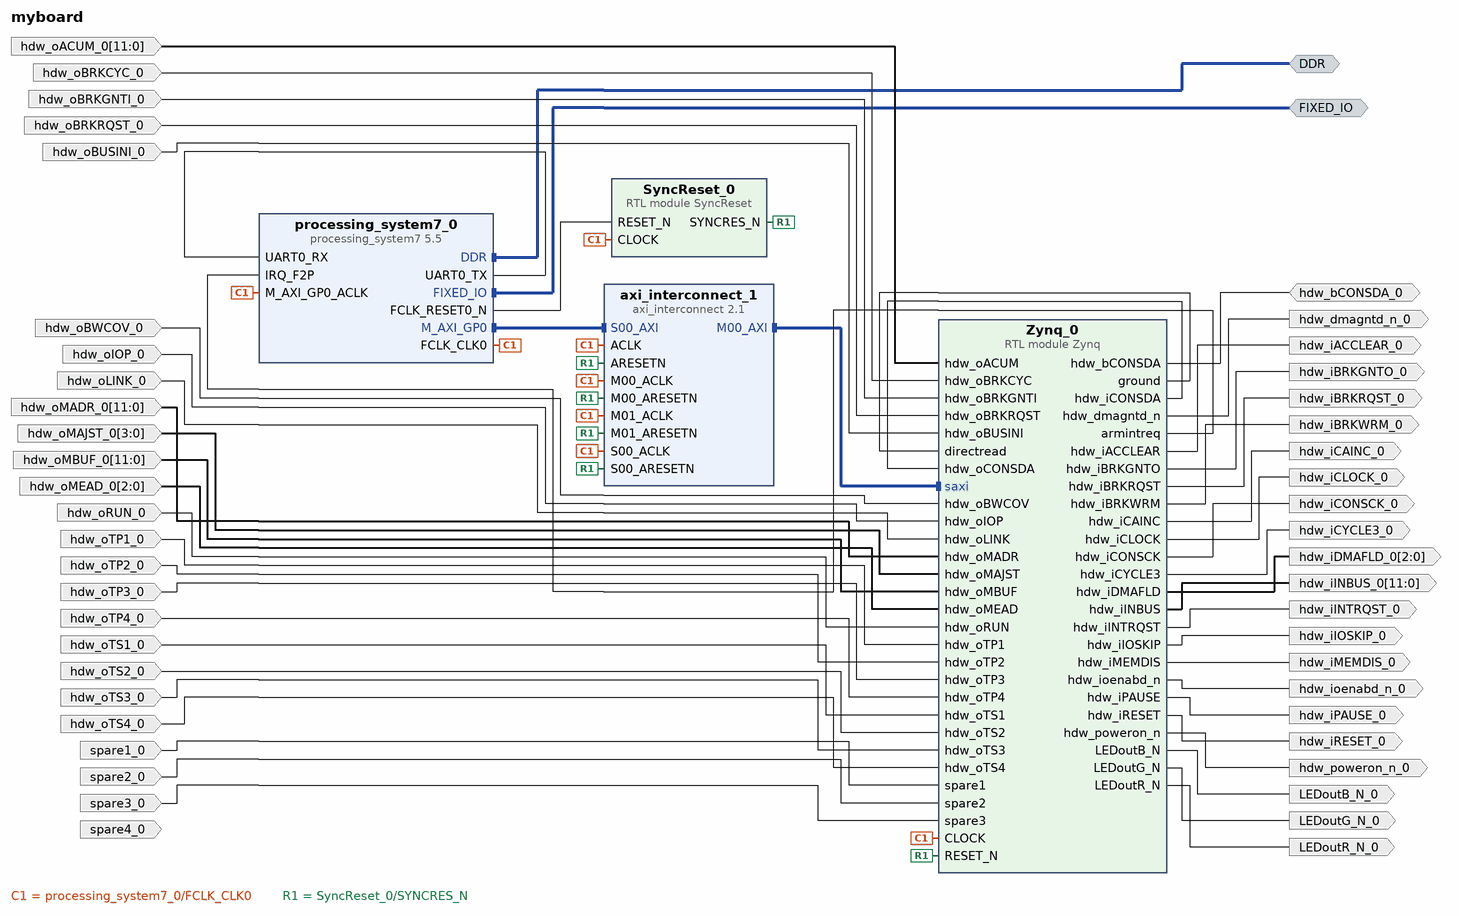
[diagram p0: block diagram of the top level]
# Vivado block design myboard, xc7z020clg400-1, Vivado 2018.3
create_bd_design myboard

create_bd_intf_port -mode Master -vlnv xilinx.com:interface:ddrx_rtl:1.0 DDR
create_bd_intf_port -mode Master -vlnv xilinx.com:display_processing_system7:fixedio_rtl:1.0 FIXED_IO
create_bd_port -dir O LEDoutB_N_0
create_bd_port -dir O LEDoutG_N_0
create_bd_port -dir O LEDoutR_N_0
create_bd_port -dir IO hdw_bCONSDA_0
create_bd_port -dir O hdw_dmagntd_n_0
create_bd_port -dir O hdw_iACCLEAR_0
create_bd_port -dir O hdw_iBRKGNTO_0
create_bd_port -dir O hdw_iBRKRQST_0
create_bd_port -dir O hdw_iBRKWRM_0
create_bd_port -dir O hdw_iCAINC_0
create_bd_port -dir O hdw_iCLOCK_0
create_bd_port -dir O hdw_iCONSCK_0
create_bd_port -dir O hdw_iCYCLE3_0
create_bd_port -dir O -from 2 -to 0 hdw_iDMAFLD_0
create_bd_port -dir O -from 11 -to 0 hdw_iINBUS_0
create_bd_port -dir O hdw_iINTRQST_0
create_bd_port -dir O hdw_iIOSKIP_0
create_bd_port -dir O hdw_iMEMDIS_0
create_bd_port -dir O hdw_iPAUSE_0
create_bd_port -dir O hdw_iRESET_0
create_bd_port -dir O hdw_ioenabd_n_0
create_bd_port -dir I -from 11 -to 0 hdw_oACUM_0
create_bd_port -dir I hdw_oBRKCYC_0
create_bd_port -dir I hdw_oBRKGNTI_0
create_bd_port -dir I hdw_oBRKRQST_0
create_bd_port -dir I hdw_oBUSINI_0
create_bd_port -dir I hdw_oBWCOV_0
create_bd_port -dir I hdw_oIOP_0
create_bd_port -dir I hdw_oLINK_0
create_bd_port -dir I -from 11 -to 0 hdw_oMADR_0
create_bd_port -dir I -from 3 -to 0 hdw_oMAJST_0
create_bd_port -dir I -from 11 -to 0 hdw_oMBUF_0
create_bd_port -dir I -from 2 -to 0 hdw_oMEAD_0
create_bd_port -dir I hdw_oRUN_0
create_bd_port -dir I hdw_oTP1_0
create_bd_port -dir I hdw_oTP2_0
create_bd_port -dir I hdw_oTP3_0
create_bd_port -dir I hdw_oTP4_0
create_bd_port -dir I hdw_oTS1_0
create_bd_port -dir I hdw_oTS2_0
create_bd_port -dir I hdw_oTS3_0
create_bd_port -dir I hdw_oTS4_0
create_bd_port -dir O hdw_poweron_n_0
create_bd_port -dir I spare1_0
create_bd_port -dir I spare2_0
create_bd_port -dir I spare3_0
create_bd_port -dir I spare4_0

create_bd_cell -type module -reference SyncReset SyncReset_0
create_bd_cell -type module -reference Zynq Zynq_0
create_bd_cell -type ip -vlnv xilinx.com:ip:axi_interconnect:2.1 axi_interconnect_1
set_property -dict {CONFIG.NUM_MI 2} [get_bd_cells axi_interconnect_1]
create_bd_cell -type ip -vlnv xilinx.com:ip:processing_system7:5.5 processing_system7_0
set_property -dict [list \
  CONFIG.PCW_APU_PERIPHERAL_FREQMHZ 666.666666 \
  CONFIG.PCW_CAN0_CAN0_IO {MIO 14 .. 15} \
  CONFIG.PCW_CAN0_PERIPHERAL_ENABLE 1 \
  CONFIG.PCW_ENET0_ENET0_IO {MIO 16 .. 27} \
  CONFIG.PCW_ENET0_GRP_MDIO_ENABLE 1 \
  CONFIG.PCW_ENET0_GRP_MDIO_IO {MIO 52 .. 53} \
  CONFIG.PCW_ENET0_PERIPHERAL_CLKSRC {ARM PLL} \
  CONFIG.PCW_ENET0_PERIPHERAL_ENABLE 1 \
  CONFIG.PCW_ENET0_RESET_ENABLE 0 \
  CONFIG.PCW_ENET_RESET_ENABLE 1 \
  CONFIG.PCW_ENET_RESET_SELECT {Share reset pin} \
  CONFIG.PCW_EN_CLK1_PORT 1 \
  CONFIG.PCW_FCLK_CLK1_BUF TRUE \
  CONFIG.PCW_FPGA0_PERIPHERAL_FREQMHZ 100 \
  CONFIG.PCW_FPGA1_PERIPHERAL_FREQMHZ 50 \
  CONFIG.PCW_FPGA_FCLK1_ENABLE 1 \
  CONFIG.PCW_GPIO_MIO_GPIO_ENABLE 1 \
  CONFIG.PCW_GPIO_MIO_GPIO_IO MIO \
  CONFIG.PCW_GPIO_PERIPHERAL_ENABLE 1 \
  CONFIG.PCW_I2C0_I2C0_IO EMIO \
  CONFIG.PCW_I2C0_PERIPHERAL_ENABLE 1 \
  CONFIG.PCW_I2C1_I2C1_IO {MIO 12 .. 13} \
  CONFIG.PCW_I2C1_PERIPHERAL_ENABLE 1 \
  CONFIG.PCW_I2C_PERIPHERAL_FREQMHZ 83.333336 \
  CONFIG.PCW_I2C_RESET_ENABLE 1 \
  CONFIG.PCW_I2C_RESET_SELECT {Share reset pin} \
  CONFIG.PCW_IRQ_F2P_INTR 1 \
  CONFIG.PCW_PRESET_BANK1_VOLTAGE {LVCMOS 1.8V} \
  CONFIG.PCW_QSPI_GRP_FBCLK_ENABLE 1 \
  CONFIG.PCW_QSPI_GRP_FBCLK_IO {MIO 8} \
  CONFIG.PCW_QSPI_GRP_SINGLE_SS_ENABLE 1 \
  CONFIG.PCW_QSPI_GRP_SINGLE_SS_IO {MIO 1 .. 6} \
  CONFIG.PCW_QSPI_PERIPHERAL_ENABLE 1 \
  CONFIG.PCW_QSPI_QSPI_IO {MIO 1 .. 6} \
  CONFIG.PCW_SD0_GRP_CD_ENABLE 1 \
  CONFIG.PCW_SD0_GRP_CD_IO {MIO 46} \
  CONFIG.PCW_SD0_GRP_WP_ENABLE 1 \
  CONFIG.PCW_SD0_GRP_WP_IO {MIO 47} \
  CONFIG.PCW_SD0_PERIPHERAL_ENABLE 1 \
  CONFIG.PCW_SD0_SD0_IO {MIO 40 .. 45} \
  CONFIG.PCW_SDIO_PERIPHERAL_FREQMHZ 100 \
  CONFIG.PCW_SINGLE_QSPI_DATA_MODE x4 \
  CONFIG.PCW_TTC0_PERIPHERAL_ENABLE 1 \
  CONFIG.PCW_TTC0_TTC0_IO EMIO \
  CONFIG.PCW_UART0_PERIPHERAL_ENABLE 1 \
  CONFIG.PCW_UART0_UART0_IO EMIO \
  CONFIG.PCW_UART1_PERIPHERAL_ENABLE 1 \
  CONFIG.PCW_UART1_UART1_IO {MIO 48 .. 49} \
  CONFIG.PCW_UART_PERIPHERAL_FREQMHZ 100 \
  CONFIG.PCW_UIPARAM_DDR_PARTNO {MT41J256M16 RE-125} \
  CONFIG.PCW_USB0_PERIPHERAL_ENABLE 1 \
  CONFIG.PCW_USB0_RESET_ENABLE 1 \
  CONFIG.PCW_USB0_RESET_IO {MIO 51} \
  CONFIG.PCW_USB0_USB0_IO {MIO 28 .. 39} \
  CONFIG.PCW_USB_RESET_ENABLE 1 \
  CONFIG.PCW_USB_RESET_SELECT {Share reset pin} \
  CONFIG.PCW_USE_FABRIC_INTERRUPT 1 \
] [get_bd_cells processing_system7_0]
# 284 more settings of processing_system7_0 are not shown: defaults, MIO pin electricals, DDR timing, and values the tool derives

# ---- connections ----

connect_bd_intf_net [get_bd_intf_pins axi_interconnect_1/M00_AXI] [get_bd_intf_pins Zynq_0/saxi]
connect_bd_intf_net [get_bd_intf_ports DDR] [get_bd_intf_pins processing_system7_0/DDR]
connect_bd_intf_net [get_bd_intf_ports FIXED_IO] [get_bd_intf_pins processing_system7_0/FIXED_IO]
connect_bd_intf_net [get_bd_intf_pins processing_system7_0/M_AXI_GP0] [get_bd_intf_pins axi_interconnect_1/S00_AXI]
connect_bd_net [get_bd_ports hdw_bCONSDA_0] [get_bd_pins Zynq_0/hdw_bCONSDA]
connect_bd_net [get_bd_pins Zynq_0/LEDoutB_N] [get_bd_ports LEDoutB_N_0]
connect_bd_net [get_bd_pins Zynq_0/LEDoutG_N] [get_bd_ports LEDoutG_N_0]
connect_bd_net [get_bd_pins Zynq_0/LEDoutR_N] [get_bd_ports LEDoutR_N_0]
connect_bd_net [get_bd_pins Zynq_0/armintreq] [get_bd_pins processing_system7_0/IRQ_F2P]
connect_bd_net [get_bd_pins Zynq_0/ground] [get_bd_pins Zynq_0/directread]
connect_bd_net [get_bd_pins Zynq_0/hdw_dmagntd_n] [get_bd_ports hdw_dmagntd_n_0]
connect_bd_net [get_bd_pins Zynq_0/hdw_iACCLEAR] [get_bd_ports hdw_iACCLEAR_0]
connect_bd_net [get_bd_pins Zynq_0/hdw_iBRKGNTO] [get_bd_ports hdw_iBRKGNTO_0]
connect_bd_net [get_bd_pins Zynq_0/hdw_iBRKRQST] [get_bd_ports hdw_iBRKRQST_0]
connect_bd_net [get_bd_pins Zynq_0/hdw_iBRKWRM] [get_bd_ports hdw_iBRKWRM_0]
connect_bd_net [get_bd_pins Zynq_0/hdw_iCAINC] [get_bd_ports hdw_iCAINC_0]
connect_bd_net [get_bd_pins Zynq_0/hdw_iCLOCK] [get_bd_ports hdw_iCLOCK_0]
connect_bd_net [get_bd_pins Zynq_0/hdw_iCONSCK] [get_bd_ports hdw_iCONSCK_0]
connect_bd_net [get_bd_pins Zynq_0/hdw_iCONSDA] [get_bd_pins Zynq_0/hdw_oCONSDA]
connect_bd_net [get_bd_pins Zynq_0/hdw_iCYCLE3] [get_bd_ports hdw_iCYCLE3_0]
connect_bd_net [get_bd_pins Zynq_0/hdw_iDMAFLD] [get_bd_ports hdw_iDMAFLD_0]
connect_bd_net [get_bd_pins Zynq_0/hdw_iINBUS] [get_bd_ports hdw_iINBUS_0]
connect_bd_net [get_bd_pins Zynq_0/hdw_iINTRQST] [get_bd_ports hdw_iINTRQST_0]
connect_bd_net [get_bd_pins Zynq_0/hdw_iIOSKIP] [get_bd_ports hdw_iIOSKIP_0]
connect_bd_net [get_bd_pins Zynq_0/hdw_iMEMDIS] [get_bd_ports hdw_iMEMDIS_0]
connect_bd_net [get_bd_pins Zynq_0/hdw_iPAUSE] [get_bd_ports hdw_iPAUSE_0]
connect_bd_net [get_bd_pins Zynq_0/hdw_iRESET] [get_bd_ports hdw_iRESET_0]
connect_bd_net [get_bd_pins Zynq_0/hdw_ioenabd_n] [get_bd_ports hdw_ioenabd_n_0]
connect_bd_net [get_bd_pins Zynq_0/hdw_poweron_n] [get_bd_ports hdw_poweron_n_0]
connect_bd_net -net hdw_oACUM_0_1 [get_bd_ports hdw_oACUM_0] [get_bd_pins Zynq_0/hdw_oACUM]
connect_bd_net -net hdw_oBRKCYC_0_1 [get_bd_ports hdw_oBRKCYC_0] [get_bd_pins Zynq_0/hdw_oBRKCYC]
connect_bd_net -net hdw_oBRKGNTI_0_1 [get_bd_ports hdw_oBRKGNTI_0] [get_bd_pins Zynq_0/hdw_oBRKGNTI]
connect_bd_net -net hdw_oBRKRQST_0_1 [get_bd_ports hdw_oBRKRQST_0] [get_bd_pins Zynq_0/hdw_oBRKRQST]
connect_bd_net -net hdw_oBUSINI_0_1 [get_bd_ports hdw_oBUSINI_0] [get_bd_pins Zynq_0/hdw_oBUSINI]
connect_bd_net -net hdw_oBWCOV_0_1 [get_bd_ports hdw_oBWCOV_0] [get_bd_pins Zynq_0/hdw_oBWCOV]
connect_bd_net -net hdw_oIOP_0_1 [get_bd_ports hdw_oIOP_0] [get_bd_pins Zynq_0/hdw_oIOP]
connect_bd_net -net hdw_oLINK_0_1 [get_bd_ports hdw_oLINK_0] [get_bd_pins Zynq_0/hdw_oLINK]
connect_bd_net -net hdw_oMADR_0_1 [get_bd_ports hdw_oMADR_0] [get_bd_pins Zynq_0/hdw_oMADR]
connect_bd_net -net hdw_oMAJST_0_1 [get_bd_ports hdw_oMAJST_0] [get_bd_pins Zynq_0/hdw_oMAJST]
connect_bd_net -net hdw_oMBUF_0_1 [get_bd_ports hdw_oMBUF_0] [get_bd_pins Zynq_0/hdw_oMBUF]
connect_bd_net -net hdw_oMEAD_0_1 [get_bd_ports hdw_oMEAD_0] [get_bd_pins Zynq_0/hdw_oMEAD]
connect_bd_net -net hdw_oRUN_0_1 [get_bd_ports hdw_oRUN_0] [get_bd_pins Zynq_0/hdw_oRUN]
connect_bd_net -net hdw_oTP1_0_1 [get_bd_ports hdw_oTP1_0] [get_bd_pins Zynq_0/hdw_oTP1]
connect_bd_net -net hdw_oTP2_0_1 [get_bd_ports hdw_oTP2_0] [get_bd_pins Zynq_0/hdw_oTP2]
connect_bd_net -net hdw_oTP3_0_1 [get_bd_ports hdw_oTP3_0] [get_bd_pins Zynq_0/hdw_oTP3]
connect_bd_net -net hdw_oTP4_0_1 [get_bd_ports hdw_oTP4_0] [get_bd_pins Zynq_0/hdw_oTP4]
connect_bd_net -net hdw_oTS1_0_1 [get_bd_ports hdw_oTS1_0] [get_bd_pins Zynq_0/hdw_oTS1]
connect_bd_net -net hdw_oTS2_0_1 [get_bd_ports hdw_oTS2_0] [get_bd_pins Zynq_0/hdw_oTS2]
connect_bd_net -net hdw_oTS3_0_1 [get_bd_ports hdw_oTS3_0] [get_bd_pins Zynq_0/hdw_oTS3]
connect_bd_net -net hdw_oTS4_0_1 [get_bd_ports hdw_oTS4_0] [get_bd_pins Zynq_0/hdw_oTS4]
connect_bd_net [get_bd_pins processing_system7_0/FCLK_CLK0] \
  [get_bd_pins processing_system7_0/M_AXI_GP0_ACLK] [get_bd_pins axi_interconnect_1/ACLK] \
  [get_bd_pins axi_interconnect_1/S00_ACLK] [get_bd_pins axi_interconnect_1/M00_ACLK] [get_bd_pins SyncReset_0/CLOCK] \
  [get_bd_pins axi_interconnect_1/M01_ACLK] [get_bd_pins Zynq_0/CLOCK]
connect_bd_net -net processing_system7_0_FCLK_RESET0_N [get_bd_pins SyncReset_0/SYNCRES_N] \
  [get_bd_pins axi_interconnect_1/M00_ARESETN] [get_bd_pins axi_interconnect_1/S00_ARESETN] \
  [get_bd_pins axi_interconnect_1/ARESETN] [get_bd_pins axi_interconnect_1/M01_ARESETN] [get_bd_pins Zynq_0/RESET_N]
connect_bd_net [get_bd_pins processing_system7_0/FCLK_RESET0_N] [get_bd_pins SyncReset_0/RESET_N]
connect_bd_net [get_bd_pins processing_system7_0/UART0_TX] [get_bd_pins processing_system7_0/UART0_RX]
connect_bd_net -net spare1_0_1 [get_bd_ports spare1_0] [get_bd_pins Zynq_0/spare1]
connect_bd_net -net spare2_0_1 [get_bd_ports spare2_0] [get_bd_pins Zynq_0/spare2]
connect_bd_net -net spare3_0_1 [get_bd_ports spare3_0] [get_bd_pins Zynq_0/spare3]
# net spare4_0_1 has one end: spare4_0

# ---- address map ----
assign_bd_address -offset 0x43C00000 -range 4K -target_address_space [get_bd_addr_spaces processing_system7_0/Data] [get_bd_addr_segs Zynq_0/saxi/reg0]

validate_bd_design
save_bd_design
